# Altium schematic sheet HDMI_Source.SchDoc
size A4; SheetNumber: 5; SheetTotal: 13
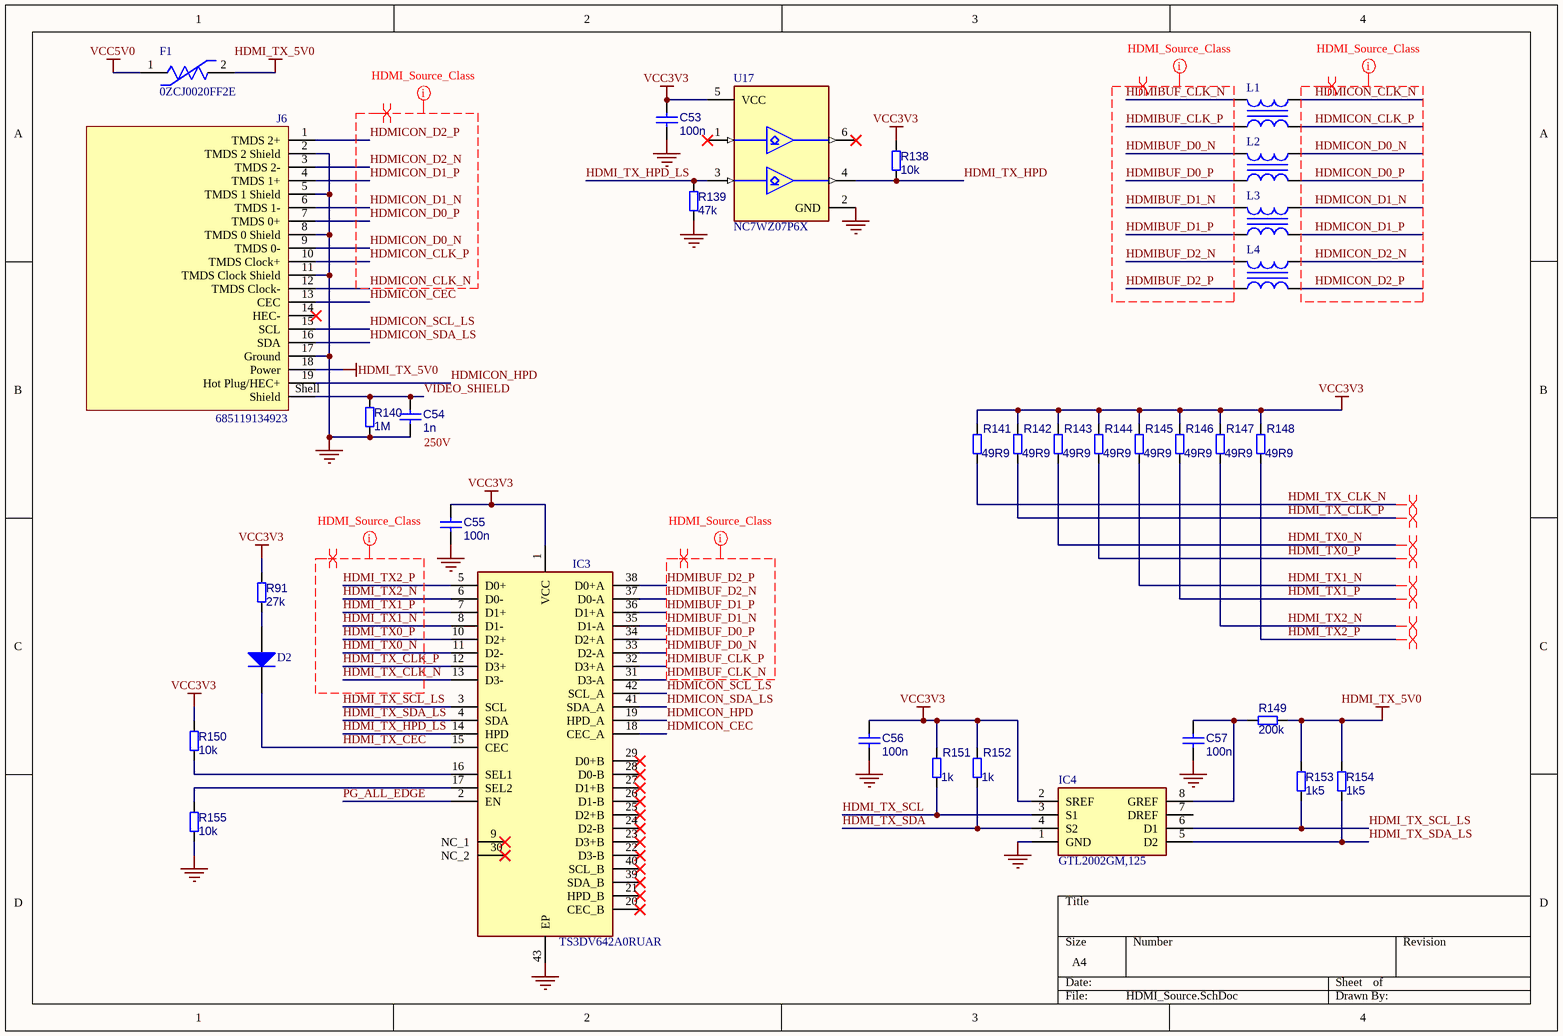
[diagram p0: HDMI_Source.SchDoc]

## Parts
C53  100n  [CAPC1005X50N_0402]
C54  1n  [CAPC1005X50N_0402]
C55  100n  [CAPC1005X50N_0402]
C56  100n  [CAPC1005X50N_0402]
C57  100n  [CAPC1005X50N_0402]
D2  BAS16XV2T1G  [ONSC-SOD-523-2-502-01_V]  (value not drawn)
F1  0ZCJ0020FF2E  [FP-0ZCJ-MFG]
IC3  TS3DV642A0RUAR  [QFN50P350X900X80-43N-D]
IC4  GTL2002GM,125  [GTL2002GM125]
J6  685119134923  [685119134923]
L1  TCM06U  [TCM06U_DFN65X50X35-4N]  (value not drawn)
L2  TCM06U  [TCM06U_DFN65X50X35-4N]  (value not drawn)
L3  TCM06U  [TCM06U_DFN65X50X35-4N]  (value not drawn)
L4  TCM06U  [TCM06U_DFN65X50X35-4N]  (value not drawn)
R91  27k  [R_0402]
R138  10k  [R_0402]
R139  47k  [R_0402]
R140  1M  [R_0402]
R141  49R9  [R_0402]
R142  49R9  [R_0402]
R143  49R9  [R_0402]
R144  49R9  [R_0402]
R145  49R9  [R_0402]
R146  49R9  [R_0402]
R147  49R9  [R_0402]
R148  49R9  [R_0402]
R149  200k  [R_0402]
R150  10k  [R_0402]
R151  1k  [R_0402]
R152  1k  [R_0402]
R153  1k5  [R_0402]
R154  1k5  [R_0402]
R155  10k  [R_0402]
U17  NC7WZ07P6X  [FP-419AD-01-MFG]

## Nets
GND: C53.1 C54.1 C55.1 C56.1 C57.1 IC3.43(EP) IC4.1(GND) J6.2(TMDS_2_Shield) J6.5(TMDS_1_Shield) J6.8(TMDS_0_Shield) J6.11(TMDS_Clock_Shield) J6.17(Ground) R139.2 R140.2 R155.2 U17.2(GND)
HDMI_TX_5V0: F1.2 J6.18(Power) R149.2 R153.1 R154.1
VCC3V3: C53.2 C55.2 C56.2 IC3.1(VCC) IC4.2(SREF) R91.1 R138.1 R141.1 R142.1 R143.1 R144.1 R145.1 R146.1 R147.1 R148.1 R150.1 R151.1 R152.1 U17.5(VCC)
VCC5V0: F1.1
HDMI_TX0_N: IC3.11(D2-) R143.2
HDMI_TX0_P: IC3.10(D2+) R144.2
HDMI_TX1_N: IC3.8(D1-) R145.2
HDMI_TX1_P: IC3.7(D1+) R146.2
HDMI_TX2_N: IC3.6(D0-) R147.2
HDMI_TX2_P: IC3.5(D0+) R148.2
HDMI_TX_CEC: D2.1(K) IC3.15(CEC)
HDMI_TX_CLK_N: IC3.13(D3-) R141.2
HDMI_TX_CLK_P: IC3.12(D3+) R142.2
HDMI_TX_HPD: R138.2 U17.4(Y2)
HDMI_TX_HPD_LS: IC3.14(HPD) R139.1 U17.3(A2)
HDMI_TX_SCL: IC4.3(S1) R151.2
HDMI_TX_SCL_LS: IC3.3(SCL) IC4.6(D1) R153.2
HDMI_TX_SDA: IC4.4(S2) R152.2
HDMI_TX_SDA_LS: IC3.4(SDA) IC4.5(D2) R154.2
HDMIBUF_CLK_N: IC3.31(D3-A) L1.4
HDMIBUF_CLK_P: IC3.32(D3+A) L1.3
HDMIBUF_D0_N: IC3.33(D2-A) L2.4
HDMIBUF_D0_P: IC3.34(D2+A) L2.3
HDMIBUF_D1_N: IC3.35(D1-A) L3.4
HDMIBUF_D1_P: IC3.36(D1+A) L3.3
HDMIBUF_D2_N: IC3.37(D0-A) L4.4
HDMIBUF_D2_P: IC3.38(D0+A) L4.3
HDMICON_CEC: IC3.18(CEC_A) J6.13(CEC)
HDMICON_CLK_N: J6.12(TMDS_Clock-) L1.1
HDMICON_CLK_P: J6.10(TMDS_Clock+) L1.2
HDMICON_D0_N: J6.9(TMDS_0-) L2.1
HDMICON_D0_P: J6.7(TMDS_0+) L2.2
HDMICON_D1_N: J6.6(TMDS_1-) L3.1
HDMICON_D1_P: J6.4(TMDS_1+) L3.2
HDMICON_D2_N: J6.3(TMDS_2-) L4.1
HDMICON_D2_P: J6.1(TMDS_2+) L4.2
HDMICON_HPD: IC3.19(HPD_A) J6.19(Hot_Plug/HEC+)
HDMICON_SCL_LS: IC3.42(SCL_A) J6.15(SCL)
HDMICON_SDA_LS: IC3.41(SDA_A) J6.16(SDA)
PG_ALL_EDGE: IC3.2(EN)
VIDEO_SHIELD: C54.2 J6.Shell(Shield) R140.1
NetC57_2: C57.2 IC4.8(GREF) R149.1
NetD2_2: D2.2(A) R91.2
NetIC3_16: IC3.16(SEL1) R150.2
NetIC3_17: IC3.17(SEL2) R155.1

Not connected (* = marked no-connect by the designer): IC3 9(NC_1)* 20(CEC_B)* 21(HPD_B)* 22(D3-B)* 23(D3+B)* 24(D2-B)* 25(D2+B)* 26(D1-B)* 27(D1+B)* 28(D0-B)* 29(D0+B)* 30(NC_2)* 39(SDA_B)* 40(SCL_B)*; IC4 7(DREF); J6 14(HEC-)*; U17 1(A1)* 6(Y1)*

## Layout directives
differential pair: HDMI_TX0_N, HDMI_TX0_P, HDMI_TX1_N, HDMI_TX1_P, HDMI_TX2_N, HDMI_TX2_P, HDMI_TX_CLK_N, HDMI_TX_CLK_P, HDMIBUF_CLK_N, HDMIBUF_CLK_P, HDMIBUF_D0_N, HDMIBUF_D0_P, HDMIBUF_D1_N, HDMIBUF_D1_P, HDMIBUF_D2_N, HDMIBUF_D2_P, HDMICON_CLK_N, HDMICON_CLK_P, HDMICON_D0_N, HDMICON_D0_P, HDMICON_D1_N, HDMICON_D1_P, HDMICON_D2_N, HDMICON_D2_P
net class HDMI_Source_Class: HDMI_TX0_N, HDMI_TX0_P, HDMI_TX1_N, HDMI_TX1_P, HDMI_TX2_N, HDMI_TX2_P, HDMI_TX_CLK_N, HDMI_TX_CLK_P, HDMIBUF_CLK_N, HDMIBUF_CLK_P, HDMIBUF_D0_N, HDMIBUF_D0_P, HDMIBUF_D1_N, HDMIBUF_D1_P, HDMIBUF_D2_N, HDMIBUF_D2_P, HDMICON_CLK_N, HDMICON_CLK_P, HDMICON_D0_N, HDMICON_D0_P, HDMICON_D1_N, HDMICON_D1_P, HDMICON_D2_N, HDMICON_D2_P

## Notes on the sheet
- (near C54) 250V

## Library data of the parts
C53-C57 = CMP-001-00084-2: MLCC 0402
D2 = CMP-1054-00076-1: Switching Diode, 2-Pin SOD-523, Pb-Free, Tape and Reel; Manufacturer: On Semiconductor; trr Max (ns): 6; Configuration: Single; IF Max (A): 0.2; ComponentLink1URL: http://www.onsemi.com/; DatasheetVersion: Rev. 7; RoHS: TRUE; PackageVersion: Rev. E, 09/2010; Packing: Tape and Reel; ComponentLink2Description: Datasheet; ComponentLink2URL: http://www.onsemi.com/pub_link/Collateral/BAS16XV2T1-D.PDF; ComponentLink3Description: Package Specification; PackageReference: SOD-523-2-502-01; ComponentLink1Description: Manufacturer URL; PartNumber: BAS16XV2T1G; Mounting Technology: Surface Mount; PackageDescription: 2-Pin SOD, Body 1.2 x 0.8 mm; ComponentLink3URL: http://www.onsemi.com/pub_link/Collateral/502-01.PDF
F1 = CMP-16043-000007-1: PTC RESET FUSE 30V 200MA 1206; Trip Current: 400mA; Approvals: UL; Power Dissipation: 400mW; Time to Trip: 0.1s; Max Current Rating: 10A; Case Code (Imperial): 1206; Max Voltage Rating (DC): 30V; Case Code (Metric): 3216; Min Operating Temperature: -40°C; Case/Package: 1206; Hold Current: 200mA; Package Quantity: 3000; Lead Free: Lead Free; Contact Plating: Tin; Number of Terminals: 2; Mount: Surface Mount; Max Operating Temperature: 85°C; Packaging: Cut Tape
IC3 = TS3DV642A0RUAR: Integrated Circuit; Manufacturer_Name: Texas Instruments; Datasheet Link: http://www.ti.com/lit/gpn/ts3dv642; Height: 0.8mm; Manufacturer_Part_Number: TS3DV642A0RUAR; Mouser Part Number: 595-TS3DV642A0RUAR; Mouser Price/Stock: https://www.mouser.co.uk/ProductDetail/Texas-Instruments/TS3DV642A0RUAR?qs=zjX5mX%252BjEMCTQjtLUY3z%2FA%3D%3D; Arrow Part Number: TS3DV642A0RUAR; Arrow Price/Stock: https://www.arrow.com/en/products/ts3dv642a0ruar/texas-instruments.html?utm_currency=USD&region=nac
IC4 = GTL2002GM,125: Integrated Circuit; Manufacturer_Name: NXP; Datasheet Link: https://componentsearchengine.com/Datasheets/2/GTL2002GM,125.pdf; Height: 0.5mm; Manufacturer_Part_Number: GTL2002GM,125; Mouser Part Number: 771-GTL2002GM125; Mouser Price/Stock: https://www.mouser.co.uk/ProductDetail/NXP-Semiconductors/GTL2002GM125?qs=me8TqzrmIYUIuvCVdWJDlA%3D%3D
J6 = CMP-1502-00169-4: HDMI Receptacle Connector 19 Position Surface Mount, Right Angle Through Hole; Contact Resistance: 30mΩ; Number of Contacts: 19; Current Rating: 500mA; Body Material: Plastic; Voltage Rating: 40V; Insulation Resistance: 10MΩ; Mount: Horizontal, Surface Mount; Connector Type: HDMI; Height: 6.28mm; Width: 15mm; Contact Material: Gold; Termination: SMD/SMT; Orientation: Horizontal; Min Operating Temperature: -25°C; RoHS: Compliant; Number of Pins: 19; REACH SVHC: Unknown; Features: Shielded; Packaging: Tape and Reel; Gender: Receptacle; Number of Positions: 19; Max Operating Temperature: 85°C; Length: 12.15mm; Color: Black
L1-L4 = CMP-006-00021-1: Common mode filters Ultra high-speed differential signal line TCM-U series
R91 R138-R155 = CMP-009-00178-3: Chip 0402 resistor
U17 = CMP-2000-06822-2: IC BUF NON-INVERT 5.5V SC70-6; Propagation Delay: 12.6ns; Max Power Dissipation: 180mW; High Level Output Current: 32mA; Number of Outputs: 2; Number of Bits per Element: 1; Polarity: Non-Inverting; Max Supply Current: 24mA; Turn-On Delay Time: 11.5ns; Logic Function: Buffer; Min Supply Voltage: 1.65V; Quiescent Current: 1uA; REACH SVHC: No SVHC; Lead Free: Lead Free; Packaging: Tape and Reel; Low Level Output Current: 32mA; Number of Channels: 2; Number of Output Lines: 2; Number of Bits: 2; Min Operating Temperature: -40°C; Radiation Hardening: No; Number of Elements: 2; Number of Pins: 6; Number of Inputs: 2; Max Supply Voltage: 5.5V; Package Quantity: 1; Termination: SMD/SMT; Number of Input Lines: 2; Number of Circuits: 2; Weight: 0.028g; Max Operating Temperature: 85°C; Case/Package: SC; Length: 2mm; Width: 1.25mm; Mount: Surface Mount; Height: 1mm